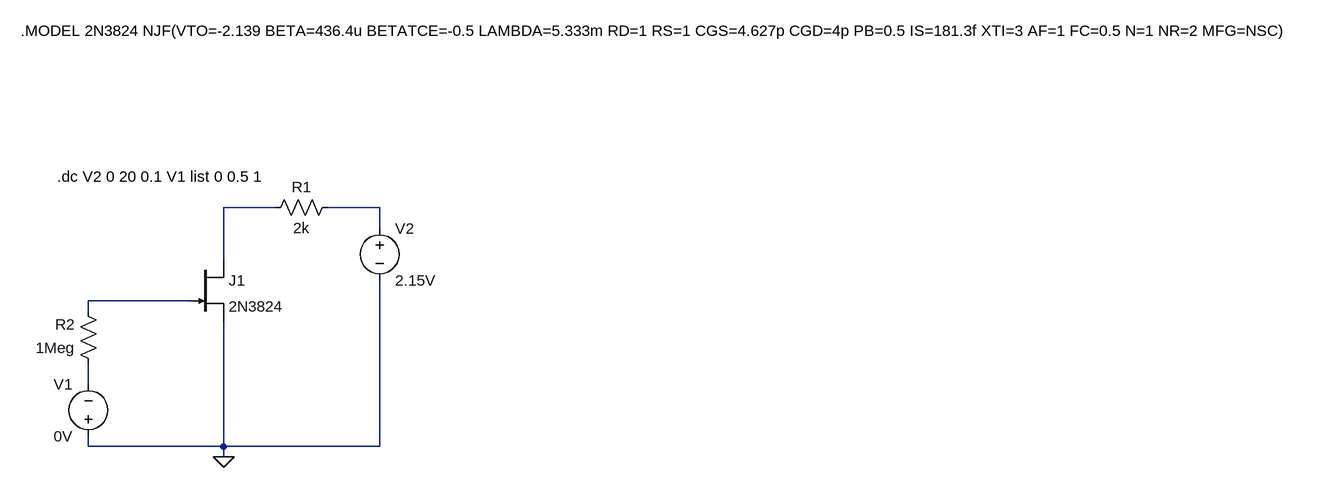
[diagram p0: schematic jfet.asc]
jfet.asc, the LTspice schematic file:
Version 4
SHEET 1 1904 680
WIRE 224 0 144 0
WIRE 384 0 304 0
WIRE 384 32 384 0
WIRE 144 80 144 0
WIRE 96 144 -64 144
WIRE -64 160 -64 144
WIRE -64 272 -64 240
WIRE -64 368 -64 352
WIRE 144 368 144 176
WIRE 144 368 -64 368
WIRE 384 368 384 112
WIRE 384 368 144 368
WIRE 144 384 144 368
FLAG 144 384 0
SYMBOL res 320 -16 R90
WINDOW 0 0 56 VBottom 2
WINDOW 3 32 56 VTop 2
SYMATTR InstName R1
SYMATTR Value 2k
SYMBOL res -48 256 R180
WINDOW 0 36 76 Left 2
WINDOW 3 36 40 Left 2
SYMATTR InstName R2
SYMATTR Value 1Meg
SYMBOL voltage -64 368 R180
WINDOW 0 24 96 Left 2
WINDOW 3 24 16 Left 2
SYMATTR InstName V1
SYMATTR Value 0V
SYMBOL voltage 384 16 R0
SYMATTR InstName V2
SYMATTR Value 2.15V
SYMBOL njf 96 80 R0
SYMATTR InstName J1
SYMATTR Value 2N3824
TEXT -168 -272 Left 2 !.MODEL 2N3824 NJF(VTO=-2.139 BETA=436.4u BETATCE=-0.5 LAMBDA=5.333m RD=1 RS=1 CGS=4.627p CGD=4p PB=0.5 IS=181.3f XTI=3 AF=1 FC=0.5 N=1 NR=2 MFG=NSC)
TEXT -112 -48 Left 2 !.dc V2 0 20 0.1 V1 list 0 0.5 1

The netlist it stands for:
* jfet.asc
R1 N002 N001 2k
R2 N004 N003 1Meg
V1 0 N004 0V
V2 N002 0 2.15V
J1 N001 N003 0 2N3824
.model NJF NJF
.model PJF PJF
.lib standard.jft
.MODEL 2N3824 NJF(VTO=-2.139 BETA=436.4u BETATCE=-0.5 LAMBDA=5.333m RD=1 RS=1 CGS=4.627p CGD=4p PB=0.5 IS=181.3f XTI=3 AF=1 FC=0.5 N=1 NR=2 MFG=NSC)
.dc V2 0 20 0.1 V1 list 0 0.5 1
.backanno
.end